# Altium schematic sheet Stara wersja zasilania.SchDoc (part 1 of 3)
size A3; SheetNumber: 16; SheetTotal: 17
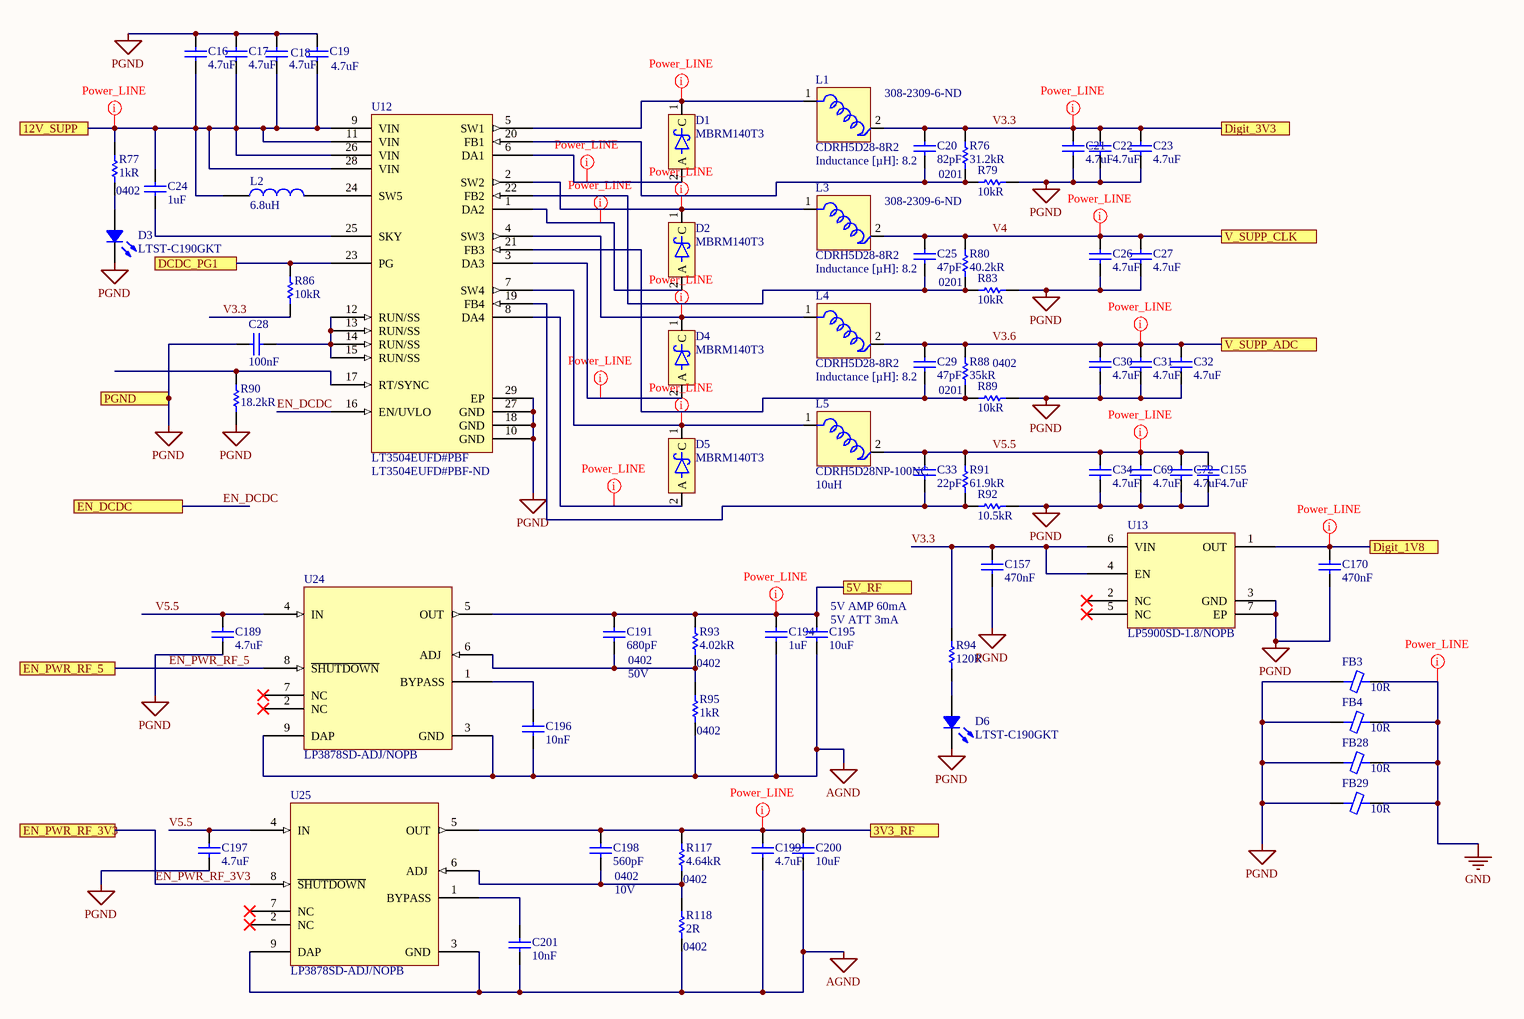
[diagram p0: Stara wersja zasilania.SchDoc]

## Parts
C16  4.7uF  [CAP 0603/1608 RF]
C17  4.7uF  [CAP 0603/1608 RF]
C18  4.7uF  [CAP 0603/1608 RF]
C19  4.7uF  [CAP 0603/1608 RF]
C20  82pF  Case/Package: 0201  [CAP 0201/0603 RF]
C21  4.7uF  [CAP 0603/1608 RF]
C22  4.7uF  [CAP 0603/1608 RF]
C23  4.7uF  [CAP 0603/1608 RF]
C24  1uF  [CAP 0402/1005 RF]
C25  47pF  Case/Package: 0201  [CAP 0201/0603 RF]
C26  4.7uF  [CAP 0603/1608 RF]
C27  4.7uF  [CAP 0603/1608 RF]
C28  100nF  [CAP 0603/1608 RF]
C29  47pF  Case/Package: 0201  [CAP 0201/0603 RF]
C30  4.7uF  [CAP 0603/1608 RF]
C31  4.7uF  [CAP 0603/1608 RF]
C32  4.7uF  [CAP 0603/1608 RF]
C33  22pF  [CAP 0402/1005 RF]
C34  4.7uF  [CAP 0603/1608 RF]
C69  4.7uF  [CAP 0603/1608 RF]
C72  4.7uF  [CAP 0603/1608 RF]
C155  4.7uF  [CAP 0603/1608 RF]
C157  470nF  [CAP 0402/1005 RF]
C170  470nF  [CAP 0402/1005 RF]
C189  4.7uF  [CAP 0603/1608 RF]
C191  680pF  Case/Package: 0402  Voltage Rating: 50V  [CAP 0402/1005 RF]
C194  1uF  [CAP 0603/1608 RF]
C195  10uF  [CAP 0805/2012 RF]
C196  10nF  [CAP 0603/1608 RF]
C197  4.7uF  [CAP 0603/1608 RF]
C198  560pF  Case/Package: 0402  Voltage Rating: 10V  [CAP 0402/1005 RF]
C199  4.7uF  [CAP 0603/1608 RF]
C200  10uF  [CAP 0805/2012 RF]
C201  10nF  [CAP 0603/1608 RF]
D1  MBRM140T3  [CASE 457]
D2  MBRM140T3  [CASE 457]
D3  LTST-C190GKT  [LED 0603/1608 GREEN]
D4  MBRM140T3  [CASE 457]
D5  MBRM140T3  [CASE 457]
D6  LTST-C190GKT  [LED 0603/1608 GREEN]
FB3  10R  [FER 0402/1005]
FB4  10R  [FER 0402/1005]
FB28  10R  [FER 0402/1005]
FB29  10R  [FER 0402/1005]
L1  CDRH5D28-8R2  Supplier Part Number 2: 308-2309-6-ND  Inductance [µH]: 8.2  [CDRH5D28]
L2  6.8uH  [FB0603]
L3  CDRH5D28-8R2  Supplier Part Number 2: 308-2309-6-ND  Inductance [µH]: 8.2  [CDRH5D28]
L4  CDRH5D28-8R2  Inductance [µH]: 8.2  [CDRH5D28]
L5  CDRH5D28NP-100NC  Inductance: 10uH  [CDRH5D28]
R76  31.2kR  [RES 0402/1005 RF]
R77  1kR  Case/Package: 0402  [RES 0402/1005 RF]
R79  10kR  [RES 0402/1005 RF]
R80  40.2kR  [RES 0402/1005 RF]
R83  10kR  [RES 0402/1005 RF]
R86  10kR  [RES 0402/1005 RF]
R88  35kR  Case/Package: 0402  [RES 0402/1005 RF]
R89  10kR  [RES 0402/1005 RF]
R90  18.2kR  [RES 0402/1005 RF]
R91  61.9kR  [RES 0402/1005 RF]
R92  10.5kR  [RES 0402/1005 RF]
R93  4.02kR  Case/Package: 0402  [RES 0402/1005 RF]
R94  120R  [RES 0402/1005 RF]
R95  1kR  Case/Package: 0402  [RES 0402/1005 RF]
R117  4.64kR  Case/Package: 0402  [RES 0402/1005 RF]
R118  2R  Case/Package: 0402  [RES 0402/1005 RF]
U12  LT3504EUFD#PBF  Supplier Part Number 1: LT3504EUFD#PBF-ND  [LT3504]
U13  LP5900SD-1.8/NOPB  [LP5900]
U24  LP3878SD-ADJ/NOPB  [LP3878-ADJ]
U25  LP3878SD-ADJ/NOPB  [LP3878-ADJ]

## Ports
3V3_RF, 5V_RF, 12V_SUPP, DCDC_PG1, Digit_1V8, Digit_3V3, EN_DCDC, EN_PWR_RF_3V3, EN_PWR_RF_5, PGND, V_SUPP_ADC, V_SUPP_CLK

## Nets
AGND: C194.1 C195.1 C196.1 C199.1 C200.1 C201.1 R95.1 R118.1 U24.3(GND) U24.9(DAP) U25.3(GND) U25.9(DAP)
GND: FB3.2 FB4.2 FB28.2 FB29.2
PGND: C16.2 C17.2 C18.2 C19.2 C21.1 C22.1 C23.1 C26.1 C27.1 C28.1 C30.1 C31.1 C32.1 C34.1 C69.1 C72.1 C155.1 C157.1 C170.1 C189.1 C197.1 D3.2 D6.2 FB3.1 FB4.1 FB28.1 FB29.1 R79.1 R83.1 R89.1 R90.1 R92.2 U12.10(GND) U12.18(GND) U12.27(GND) U12.29(EP) U13.3(GND) U13.7(EP) ; port PGND
3V3_RF: C198.2 C199.2 C200.2 R117.2 U25.5(OUT) ; port 3V3_RF
5V_RF: C191.2 C194.2 C195.2 R93.2 U24.5(OUT) ; port 5V_RF
12V_SUPP: C16.1 C17.1 C18.1 C19.1 C24.2 L2.1 R77.2 U12.9(VIN) U12.11(VIN) U12.26(VIN) U12.28(VIN) ; port 12V_SUPP
DCDC_PG1: R86.1 U12.23(PG) ; port DCDC_PG1
Digit_1V8: C170.2 U13.1(OUT) ; port Digit_1V8
EN_DCDC: U12.16(EN/UVLO) ; port EN_DCDC
EN_PWR_RF_3V3: U25.8(~{SHUTDOWN}) ; port EN_PWR_RF_3V3
EN_PWR_RF_5: U24.8(~{SHUTDOWN}) ; port EN_PWR_RF_5
V3.3: C20.2 C21.2 C22.2 C23.2 C157.2 L1.2 R76.2 R86.2 R94.2 U13.4(EN) U13.6(VIN) ; port Digit_3V3
V3.6: C29.2 C30.2 C31.2 C32.2 L4.2 R88.2 ; port V_SUPP_ADC
V4: C25.2 C26.2 C27.2 L3.2 R80.2 ; port V_SUPP_CLK
V5.5: C33.2 C34.2 C69.2 C72.2 C155.2 C189.2 C197.2 L5.2 R91.1 U24.4(IN) U25.4(IN)
NetC20_1: C20.1 R76.1 R79.2 U12.20(FB1)
NetC24_1: C24.1 U12.25(SKY)
NetC25_1: C25.1 R80.1 R83.2 U12.22(FB2)
NetC28_2: C28.2 U12.12(RUN/SS) U12.13(RUN/SS) U12.14(RUN/SS) U12.15(RUN/SS)
NetC29_1: C29.1 R88.1 R89.2 U12.21(FB3)
NetC33_1: C33.1 R91.2 R92.1 U12.19(FB4)
NetC191_1: C191.1 R93.1 R95.2 U24.6(ADJ)
NetC196_2: C196.2 U24.1(BYPASS)
NetC198_1: C198.1 R117.1 R118.2 U25.6(ADJ)
NetC201_2: C201.2 U25.1(BYPASS)
NetD1_1: D1.1(C) L1.1 U12.5(SW1)
NetD1_2: D1.2(A) U12.6(DA1)
NetD2_1: D2.1(C) L3.1 U12.2(SW2)
NetD2_2: D2.2(A) U12.1(DA2)
NetD3_1: D3.1 R77.1
NetD4_1: D4.1(C) L4.1 U12.4(SW3)
NetD4_2: D4.2(A) U12.3(DA3)
NetD5_1: D5.1(C) L5.1 U12.7(SW4)
NetD5_2: D5.2(A) U12.8(DA4)
NetD6_1: D6.1 R94.1
NetL2_2: L2.2 U12.24(SW5)
NetR90_2: R90.2 U12.17(RT/SYNC)

Not connected (* = marked no-connect by the designer): U13 2(NC)* 5(NC)*; U24 2(NC)* 7(NC)*; U25 2(NC)* 7(NC)*

## Layout directives
net class Power_LINE: 3V3_RF, 5V_RF, 12V_SUPP, Digit_1V8, GND, NetD1_1, NetD1_2, NetD2_1, NetD2_2, NetD4_1, NetD4_2, NetD5_1, NetD5_2, V3.3, V3.6, V4, V5.5

## Notes on the sheet
- (near C195) 5V AMP 60mA
- (near C195) 5V ATT 3mA
- Title
- Size:
- Date:
- A3
- Number:
- Time:
- Revision:
- Sheet
- of
- File: